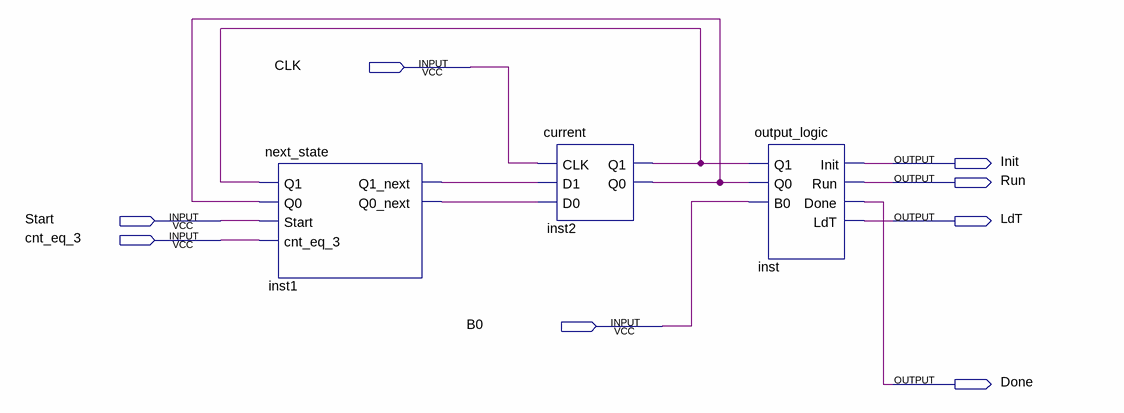
[diagram p0: schematic sheet]
// Quartus schematic control_unit.bdf as structural Verilog: 3 symbols, 8 pins
module control_unit (
  input  CLK,
  input  Start,
  input  cnt_eq_3,
  input  B0,
  output Init,
  output Run,
  output LdT,
  output Done
);

  wire inst1_q0_next, inst1_q1_next, inst2_q0, inst2_q1;

  next_state inst1 (
    .Q1(inst2_q1), .Q0(inst2_q0), .Start(Start), .cnt_eq_3(cnt_eq_3), .Q1_next(inst1_q1_next),
    .Q0_next(inst1_q0_next));
  current inst2 (.CLK(CLK), .D1(inst1_q1_next), .D0(inst1_q0_next), .Q1(inst2_q1), .Q0(inst2_q0));
  output_logic inst (.Q1(inst2_q1), .Q0(inst2_q0), .B0(B0), .Init(Init), .Run(Run), .Done(Done), .LdT(LdT));
endmodule
